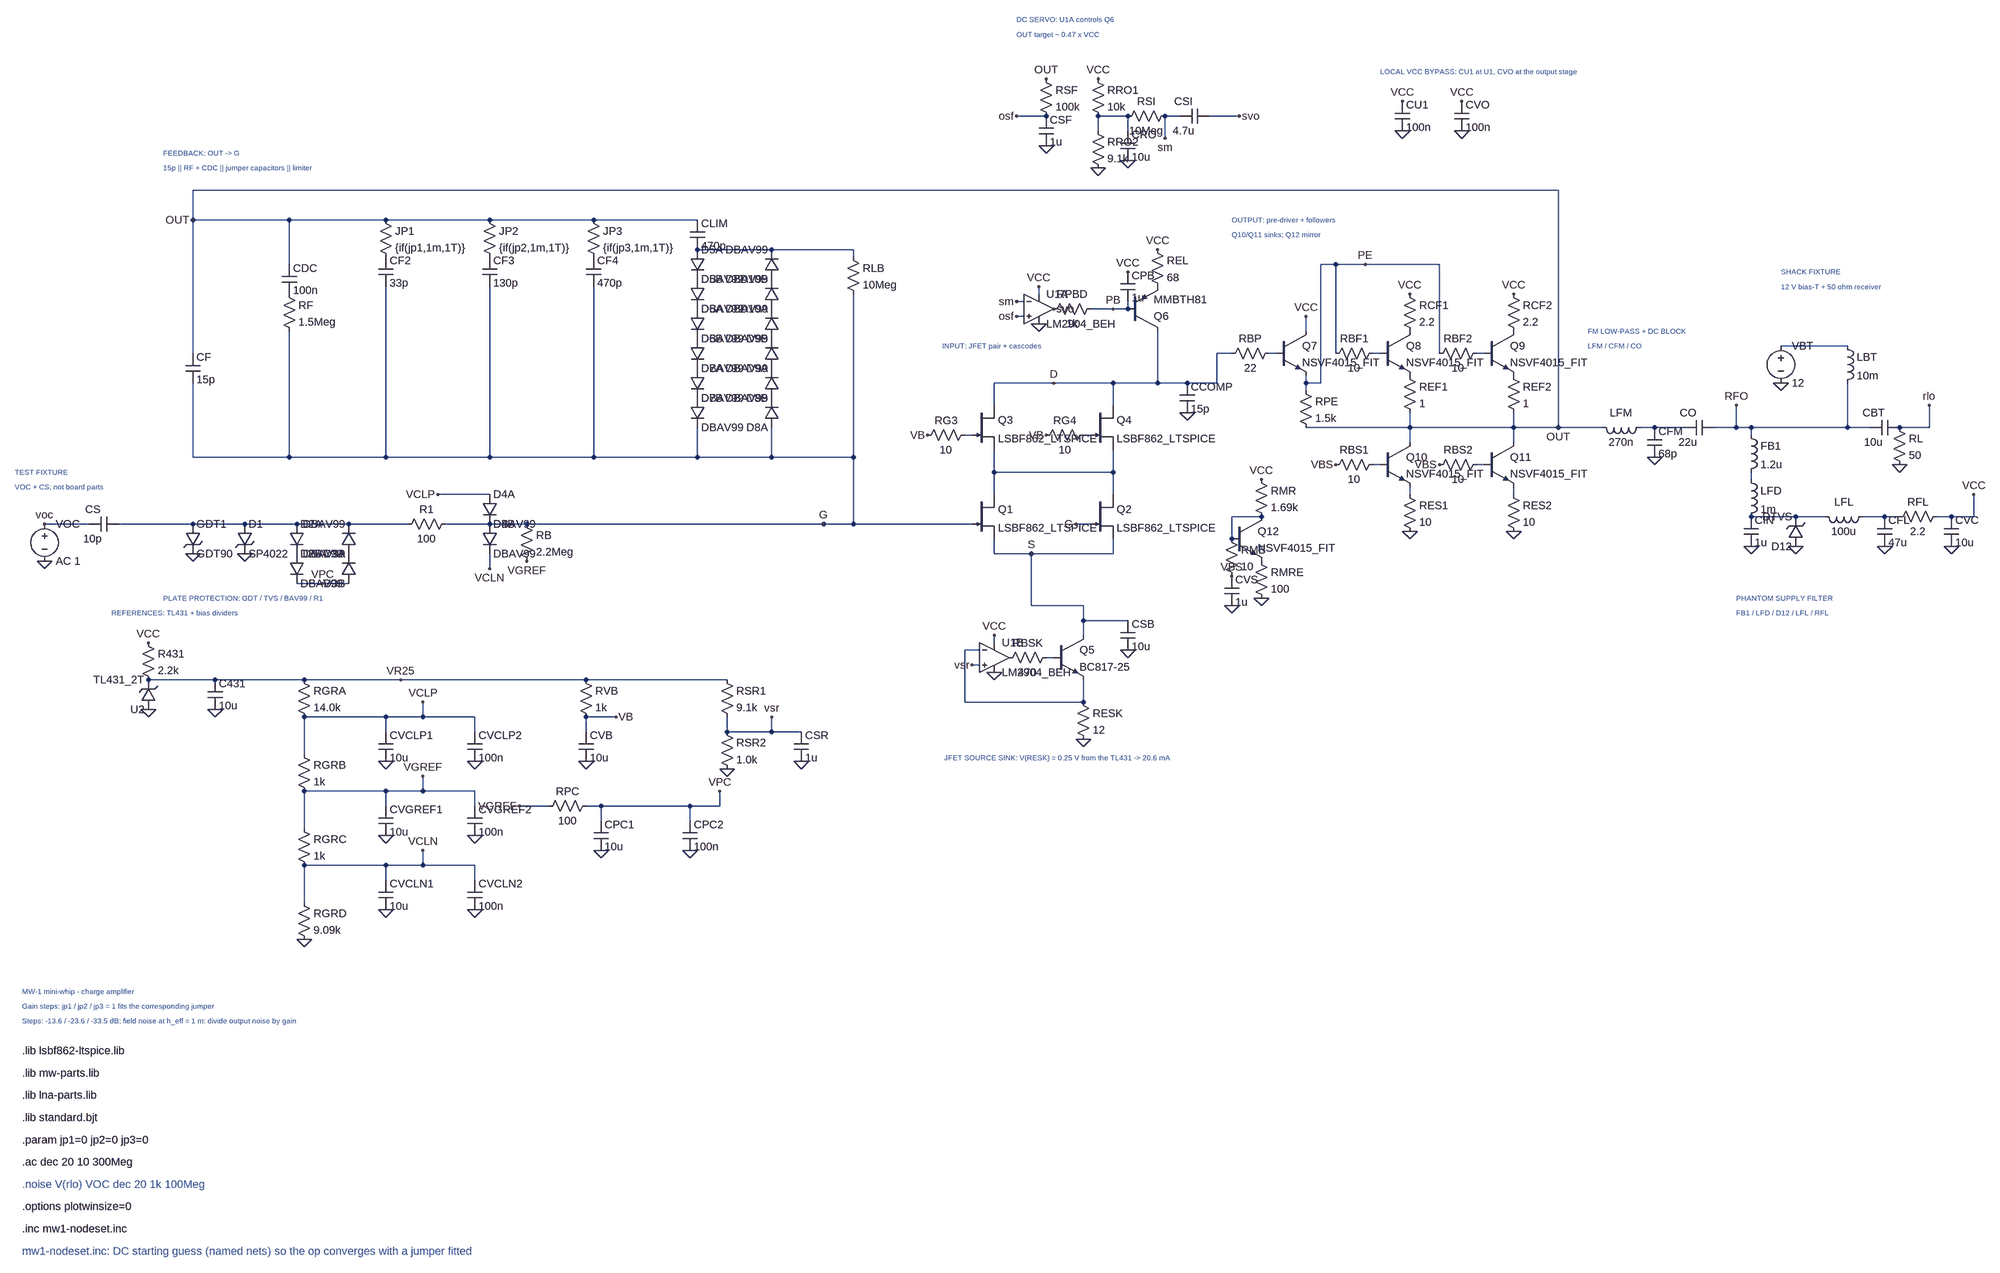
[diagram p0: schematic mw1.asc]
mw1.asc, the LTspice schematic file:
Version 4
SHEET 1 4400 2000
WIRE -2560 -144 -2464 -144
WIRE -2016 -16 -1960 -16
WIRE -1960 -16 -1904 -16
WIRE -2400 -144 -2240 -144
WIRE -2240 -144 -2128 -144
WIRE -2128 -144 -2016 -144
WIRE -2016 -144 -1904 -144
WIRE -1904 -144 -1776 -144
WIRE -1712 -208 -1600 -208
WIRE -1600 -80 -1600 -48
WIRE -2240 -800 -2240 -512
WIRE -2240 -448 -2240 -288
WIRE -2032 -800 -2032 -704
WIRE -2032 -560 -2032 -288
WIRE -1824 -656 -1824 -288
WIRE -1600 -656 -1600 -288
WIRE -1376 -656 -1376 -288
WIRE -1152 -736 -992 -736
WIRE -992 -736 -816 -736
WIRE -816 -736 -816 -720
WIRE -1152 -352 -1152 -288
WIRE -992 -352 -992 -288
WIRE -816 -640 -816 -288
WIRE -2240 -800 -2032 -800
WIRE -2032 -800 -1824 -800
WIRE -1824 -800 -1600 -800
WIRE -1600 -800 -1376 -800
WIRE -1376 -800 -1152 -800
WIRE -2240 -288 -2032 -288
WIRE -2032 -288 -1824 -288
WIRE -1824 -288 -1600 -288
WIRE -1600 -288 -1376 -288
WIRE -1376 -288 -1152 -288
WIRE -1152 -288 -992 -288
WIRE -992 -288 -816 -288
WIRE -816 -288 -816 -144
WIRE -880 -144 -816 -144
WIRE -1696 -144 -1600 -144
WIRE -1600 -144 -1520 -144
WIRE -1520 -144 -880 -144
WIRE -880 -144 -816 -144
WIRE -816 -144 -592 -144
WIRE -592 -144 -560 -144
WIRE -336 -144 -304 -144
WIRE -512 -256 -512 -208
WIRE -512 -256 -256 -256
WIRE -256 -256 -256 -208
WIRE -512 -304 -512 -256
WIRE -256 -304 -256 -256
WIRE -512 -112 -512 -80
WIRE -512 -80 -432 -80
WIRE -432 -80 -256 -80
WIRE -256 -112 -256 -80
WIRE -576 -336 -560 -336
WIRE -320 -336 -304 -336
WIRE -512 -448 -512 -400
WIRE -256 -448 -256 -400
WIRE -512 -448 -384 -448
WIRE -384 -448 -256 -448
WIRE -256 -448 -160 -448
WIRE -160 -448 -96 -448
WIRE -96 -448 -32 -448
WIRE -32 -512 -32 -448
WIRE -32 -512 0 -512
WIRE -320 64 -320 96
WIRE -432 -80 -432 32
WIRE -432 32 -320 32
WIRE -320 32 -320 64
WIRE -320 64 -224 64
WIRE -320 192 -320 240
WIRE -400 144 -384 144
WIRE -576 128 -544 128
WIRE -576 128 -576 240
WIRE -576 240 -320 240
WIRE -560 160 -544 160
WIRE -512 96 -512 112
WIRE -160 -560 -160 -448
WIRE -288 -608 -256 -608
WIRE -256 -608 -224 -608
WIRE -224 -624 -224 -608
WIRE -304 -608 -288 -608
WIRE -464 -592 -448 -592
WIRE -464 -624 -448 -624
WIRE -416 -656 -416 -640
WIRE -464 -1024 -400 -1024
WIRE -288 -1024 -288 -992
WIRE -288 -1024 -224 -1024
WIRE -224 -1024 -224 -992
WIRE -144 -1024 -112 -1024
WIRE -144 -1024 -144 -976
WIRE -48 -1024 16 -1024
WIRE 80 -512 96 -512
WIRE 160 -592 160 -560
WIRE 160 -464 160 -448
WIRE 160 -448 160 -432
WIRE 304 -512 320 -512
WIRE 224 -704 224 -512
WIRE 384 -384 384 -352
WIRE 384 -352 384 -320
WIRE 384 -224 384 -208
WIRE 304 -272 320 -272
WIRE 528 -512 544 -512
WIRE 448 -704 448 -512
WIRE 608 -384 608 -352
WIRE 608 -352 608 -320
WIRE 608 -224 608 -208
WIRE 528 -272 544 -272
WIRE 160 -448 192 -448
WIRE 192 -704 192 -448
WIRE 192 -704 224 -704
WIRE 224 -704 288 -704
WIRE 288 -704 448 -704
WIRE 160 -352 384 -352
WIRE 384 -352 608 -352
WIRE 608 -352 704 -352
WIRE 704 -352 800 -352
WIRE 704 -864 704 -352
WIRE -2240 -864 704 -864
WIRE -2240 -864 -2240 -800
WIRE 0 -160 0 -112
WIRE 0 -160 64 -160
WIRE 880 -352 912 -352
WIRE 912 -352 976 -352
WIRE 1088 -400 1088 -352
WIRE 1040 -352 1088 -352
WIRE 1088 -352 1120 -352
WIRE 1120 -352 1120 -336
WIRE 1120 -256 1120 -240
WIRE 1120 -160 1216 -160
WIRE 1216 -160 1280 -160
WIRE 1360 -160 1408 -160
WIRE 1408 -160 1440 -160
WIRE 1520 -160 1552 -160
WIRE 1552 -160 1600 -160
WIRE 1600 -208 1600 -160
WIRE 1120 -352 1328 -352
WIRE 1328 -352 1376 -352
WIRE 1440 -352 1504 -352
WIRE 1504 -400 1504 -352
WIRE 1328 -448 1328 -352
WIRE 1184 -528 1328 -528
WIRE -2336 192 -2192 192
WIRE -2192 192 -2000 192
WIRE -2000 192 -1792 192
WIRE -1792 192 -1392 192
WIRE -1392 192 -1088 192
WIRE -2000 272 -2000 352
WIRE -2000 272 -1824 272
WIRE -1824 272 -1744 272
WIRE -1744 272 -1632 272
WIRE -1744 240 -1744 272
WIRE -1824 272 -1824 304
WIRE -1632 272 -1632 304
WIRE -2000 432 -2000 512
WIRE -2000 432 -1824 432
WIRE -1824 432 -1744 432
WIRE -1744 432 -1632 432
WIRE -1744 400 -1744 432
WIRE -1824 432 -1824 464
WIRE -1632 432 -1632 464
WIRE -2000 592 -2000 672
WIRE -2000 592 -1824 592
WIRE -1824 592 -1744 592
WIRE -1744 592 -1632 592
WIRE -1744 560 -1744 592
WIRE -1824 592 -1824 624
WIRE -1632 592 -1632 624
WIRE -1536 464 -1472 464
WIRE -1392 464 -1360 464
WIRE -1360 464 -1168 464
WIRE -1168 464 -1104 464
WIRE -1360 464 -1360 496
WIRE -1168 464 -1168 496
WIRE -1104 432 -1104 464
WIRE -1392 272 -1392 304
WIRE -1392 272 -1328 272
WIRE -1088 272 -1088 304
WIRE -1088 304 -992 304
WIRE -992 304 -928 304
WIRE -992 272 -992 304
FLAG -2560 -64 0
FLAG -2560 -144 voc
FLAG -2240 -80 0
FLAG -2128 -80 0
FLAG -1960 -16 VPC
FLAG -1712 -208 VCLP
FLAG -1600 -48 VCLN
FLAG -1520 -64 VGREF
FLAG -2240 -800 OUT
FLAG -880 -144 G
FLAG -336 -144 G
FLAG -432 -80 S
FLAG -656 -336 VB
FLAG -400 -336 VB
FLAG -384 -448 D
FLAG -96 -384 0
FLAG -224 128 0
FLAG -320 320 0
FLAG -560 160 vsr
FLAG -512 96 VCC
FLAG -512 176 0
FLAG -160 -736 VCC
FLAG -256 -608 PB
FLAG -224 -688 VCC
FLAG -464 -592 osf
FLAG -464 -624 sm
FLAG -416 -656 VCC
FLAG -416 -576 0
FLAG -384 -608 svo
FLAG -400 -1104 OUT
FLAG -400 -960 0
FLAG -464 -1024 osf
FLAG -288 -1104 VCC
FLAG -288 -912 0
FLAG -224 -928 0
FLAG -144 -976 sm
FLAG 16 -1024 svo
FLAG -384 -608 svo
FLAG 160 -592 VCC
FLAG 384 -640 VCC
FLAG 384 -128 0
FLAG 224 -272 VBS
FLAG 608 -640 VCC
FLAG 608 -128 0
FLAG 448 -272 VBS
FLAG 288 -704 PE
FLAG 704 -352 OUT
FLAG 64 -240 VCC
FLAG 64 16 0
FLAG 0 -32 VBS
FLAG 0 32 0
FLAG 368 -1056 VCC
FLAG 368 -992 0
FLAG 496 -1056 VCC
FLAG 496 -992 0
FLAG 912 -288 0
FLAG 1088 -400 RFO
FLAG 1120 -96 0
FLAG 1216 -96 0
FLAG 1408 -96 0
FLAG 1552 -96 0
FLAG 1600 -208 VCC
FLAG 1440 -272 0
FLAG 1504 -400 rlo
FLAG 1184 -448 0
FLAG -2336 112 VCC
FLAG -2336 256 0
FLAG -2192 256 0
FLAG -1792 192 VR25
FLAG -2000 752 0
FLAG -1744 240 VCLP
FLAG -1824 368 0
FLAG -1632 368 0
FLAG -1744 400 VGREF
FLAG -1824 528 0
FLAG -1632 528 0
FLAG -1744 560 VCLN
FLAG -1824 688 0
FLAG -1632 688 0
FLAG -1536 464 VGREF
FLAG -1360 560 0
FLAG -1168 560 0
FLAG -1104 432 VPC
FLAG -1392 368 0
FLAG -1328 272 VB
FLAG -1088 384 0
FLAG -928 368 0
FLAG -992 272 vsr
SYMBOL voltage -2560 -160 R0
SYMATTR InstName VOC
SYMATTR Value AC 1
SYMBOL cap -2400 -160 R90
WINDOW 0 0 56 VBottom 2
WINDOW 3 32 56 VTop 2
SYMATTR InstName CS
SYMATTR Value 10p
SYMBOL zener -2256 -144 R0
SYMATTR Prefix X
SYMATTR InstName GDT1
SYMATTR Value GDT90
SYMBOL TVSdiode -2144 -144 R0
SYMATTR Prefix X
SYMATTR InstName D1
SYMATTR Value SP4022
SYMBOL diode -2032 -144 R0
SYMATTR InstName D2A
SYMATTR Value DBAV99
SYMBOL diode -2032 -80 R0
SYMATTR InstName D2B
SYMATTR Value DBAV99
SYMBOL diode -1888 -80 R180
SYMATTR InstName D3A
SYMATTR Value DBAV99
SYMBOL diode -1888 -16 R180
SYMATTR InstName D3B
SYMATTR Value DBAV99
SYMBOL res -1680 -160 R90
WINDOW 0 0 56 VBottom 2
WINDOW 3 32 56 VTop 2
SYMATTR InstName R1
SYMATTR Value 100
SYMBOL diode -1616 -208 R0
SYMATTR InstName D4A
SYMATTR Value DBAV99
SYMBOL diode -1616 -144 R0
SYMATTR InstName D4B
SYMATTR Value DBAV99
SYMBOL res -1536 -160 R0
SYMATTR InstName RB
SYMATTR Value 2.2Meg
SYMBOL cap -2256 -512 R0
SYMATTR InstName CF
SYMATTR Value 15p
SYMBOL cap -2048 -704 R0
SYMATTR InstName CDC
SYMATTR Value 100n
SYMBOL res -2048 -656 R0
SYMATTR InstName RF
SYMATTR Value 1.5Meg
SYMBOL res -1840 -816 R0
SYMATTR InstName JP1
SYMATTR Value {if(jp1,1m,1T)}
SYMBOL cap -1840 -720 R0
SYMATTR InstName CF2
SYMATTR Value 33p
SYMBOL res -1616 -816 R0
SYMATTR InstName JP2
SYMATTR Value {if(jp2,1m,1T)}
SYMBOL cap -1616 -720 R0
SYMATTR InstName CF3
SYMATTR Value 130p
SYMBOL res -1392 -816 R0
SYMATTR InstName JP3
SYMATTR Value {if(jp3,1m,1T)}
SYMBOL cap -1392 -720 R0
SYMATTR InstName CF4
SYMATTR Value 470p
SYMBOL cap -1168 -800 R0
SYMATTR InstName CLIM
SYMATTR Value 470p
SYMBOL diode -1168 -736 R0
SYMATTR InstName D5A
SYMATTR Value DBAV99
SYMBOL diode -1168 -672 R0
SYMATTR InstName D5B
SYMATTR Value DBAV99
SYMBOL diode -1168 -608 R0
SYMATTR InstName D6A
SYMATTR Value DBAV99
SYMBOL diode -1168 -544 R0
SYMATTR InstName D6B
SYMATTR Value DBAV99
SYMBOL diode -1168 -480 R0
SYMATTR InstName D7A
SYMATTR Value DBAV99
SYMBOL diode -1168 -416 R0
SYMATTR InstName D7B
SYMATTR Value DBAV99
SYMBOL diode -976 -352 R180
SYMATTR InstName D8A
SYMATTR Value DBAV99
SYMBOL diode -976 -416 R180
SYMATTR InstName D8B
SYMATTR Value DBAV99
SYMBOL diode -976 -480 R180
SYMATTR InstName D9A
SYMATTR Value DBAV99
SYMBOL diode -976 -544 R180
SYMATTR InstName D9B
SYMATTR Value DBAV99
SYMBOL diode -976 -608 R180
SYMATTR InstName D10A
SYMATTR Value DBAV99
SYMBOL diode -976 -672 R180
SYMATTR InstName D10B
SYMATTR Value DBAV99
SYMBOL res -832 -736 R0
SYMATTR InstName RLB
SYMATTR Value 10Meg
SYMBOL njf -560 -208 R0
SYMATTR InstName Q1
SYMATTR Value LSBF862_LTSPICE
SYMBOL njf -304 -208 R0
SYMATTR InstName Q2
SYMATTR Value LSBF862_LTSPICE
SYMBOL njf -560 -400 R0
SYMATTR InstName Q3
SYMATTR Value LSBF862_LTSPICE
SYMBOL njf -304 -400 R0
SYMATTR InstName Q4
SYMATTR Value LSBF862_LTSPICE
SYMBOL res -560 -352 R90
WINDOW 0 0 56 VBottom 2
WINDOW 3 32 56 VTop 2
SYMATTR InstName RG3
SYMATTR Value 10
SYMBOL res -304 -352 R90
WINDOW 0 0 56 VBottom 2
WINDOW 3 32 56 VTop 2
SYMATTR InstName RG4
SYMATTR Value 10
SYMBOL cap -112 -448 R0
SYMATTR InstName CCOMP
SYMATTR Value 15p
SYMBOL npn -384 96 R0
SYMATTR InstName Q5
SYMATTR Value BC817-25
SYMBOL cap -240 64 R0
SYMATTR InstName CSB
SYMATTR Value 10u
SYMBOL res -336 224 R0
SYMATTR InstName RESK
SYMATTR Value 12
SYMBOL res -384 128 R90
WINDOW 0 0 56 VBottom 2
WINDOW 3 32 56 VTop 2
SYMATTR InstName RBSK
SYMATTR Value 470
SYMBOL OpAmps\\opamp2 -512 80 R0
SYMATTR Prefix X
SYMATTR InstName U1B
SYMATTR Value LM2904_BEH
SYMBOL pnp -224 -560 M180
SYMATTR InstName Q6
SYMATTR Value MMBTH81
SYMBOL res -176 -752 R0
SYMATTR InstName REL
SYMATTR Value 68
SYMBOL cap -240 -688 R0
SYMATTR InstName CPB
SYMATTR Value 1u
SYMBOL res -288 -624 R90
WINDOW 0 0 56 VBottom 2
WINDOW 3 32 56 VTop 2
SYMATTR InstName RPBD
SYMATTR Value 1k
SYMBOL OpAmps\\opamp2 -416 -672 R0
SYMATTR Prefix X
SYMATTR InstName U1A
SYMATTR Value LM2904_BEH
SYMBOL res -416 -1120 R0
SYMATTR InstName RSF
SYMATTR Value 100k
SYMBOL cap -416 -1024 R0
SYMATTR InstName CSF
SYMATTR Value 1u
SYMBOL res -304 -1120 R0
SYMATTR InstName RRO1
SYMATTR Value 10k
SYMBOL res -304 -1008 R0
SYMATTR InstName RRO2
SYMATTR Value 9.1k
SYMBOL cap -240 -992 R0
SYMATTR InstName CRO
SYMATTR Value 10u
SYMBOL res -128 -1040 R90
WINDOW 0 0 56 VBottom 2
WINDOW 3 32 56 VTop 2
SYMATTR InstName RSI
SYMATTR Value 10Meg
SYMBOL cap -48 -1040 R90
WINDOW 0 0 56 VBottom 2
WINDOW 3 32 56 VTop 2
SYMATTR InstName CSI
SYMATTR Value 4.7u
SYMBOL npn 96 -560 R0
SYMATTR Prefix X
SYMATTR InstName Q7
SYMATTR Value NSVF4015_FIT
SYMBOL res 96 -528 R90
WINDOW 0 0 56 VBottom 2
WINDOW 3 32 56 VTop 2
SYMATTR InstName RBP
SYMATTR Value 22
SYMBOL res 144 -448 R0
SYMATTR InstName RPE
SYMATTR Value 1.5k
SYMBOL npn 320 -560 R0
SYMATTR Prefix X
SYMATTR InstName Q8
SYMATTR Value NSVF4015_FIT
SYMBOL res 320 -528 R90
WINDOW 0 0 56 VBottom 2
WINDOW 3 32 56 VTop 2
SYMATTR InstName RBF1
SYMATTR Value 10
SYMBOL res 368 -656 R0
SYMATTR InstName RCF1
SYMATTR Value 2.2
SYMBOL res 368 -480 R0
SYMATTR InstName REF1
SYMATTR Value 1
SYMBOL npn 320 -320 R0
SYMATTR Prefix X
SYMATTR InstName Q10
SYMATTR Value NSVF4015_FIT
SYMBOL res 368 -224 R0
SYMATTR InstName RES1
SYMATTR Value 10
SYMBOL res 320 -288 R90
WINDOW 0 0 56 VBottom 2
WINDOW 3 32 56 VTop 2
SYMATTR InstName RBS1
SYMATTR Value 10
SYMBOL npn 544 -560 R0
SYMATTR Prefix X
SYMATTR InstName Q9
SYMATTR Value NSVF4015_FIT
SYMBOL res 544 -528 R90
WINDOW 0 0 56 VBottom 2
WINDOW 3 32 56 VTop 2
SYMATTR InstName RBF2
SYMATTR Value 10
SYMBOL res 592 -656 R0
SYMATTR InstName RCF2
SYMATTR Value 2.2
SYMBOL res 592 -480 R0
SYMATTR InstName REF2
SYMATTR Value 1
SYMBOL npn 544 -320 R0
SYMATTR Prefix X
SYMATTR InstName Q11
SYMATTR Value NSVF4015_FIT
SYMBOL res 592 -224 R0
SYMATTR InstName RES2
SYMATTR Value 10
SYMBOL res 544 -288 R90
WINDOW 0 0 56 VBottom 2
WINDOW 3 32 56 VTop 2
SYMATTR InstName RBS2
SYMATTR Value 10
SYMBOL npn 0 -160 R0
SYMATTR Prefix X
SYMATTR InstName Q12
SYMATTR Value NSVF4015_FIT
SYMBOL res 48 -256 R0
SYMATTR InstName RMR
SYMATTR Value 1.69k
SYMBOL res 48 -80 R0
SYMATTR InstName RMRE
SYMATTR Value 100
SYMBOL res -16 -128 R0
SYMATTR InstName RMB
SYMATTR Value 10
SYMBOL cap -16 -32 R0
SYMATTR InstName CVS
SYMATTR Value 1u
SYMBOL cap 352 -1056 R0
SYMATTR InstName CU1
SYMATTR Value 100n
SYMBOL cap 480 -1056 R0
SYMATTR InstName CVO
SYMATTR Value 100n
SYMBOL ind 896 -368 R90
WINDOW 0 0 56 VBottom 2
WINDOW 3 32 56 VTop 2
SYMATTR InstName LFM
SYMATTR Value 270n
SYMBOL cap 896 -352 R0
SYMATTR InstName CFM
SYMATTR Value 68p
SYMBOL cap 1040 -368 R90
WINDOW 0 0 56 VBottom 2
WINDOW 3 32 56 VTop 2
SYMATTR InstName CO
SYMATTR Value 22u
SYMBOL ind 1104 -352 R0
SYMATTR InstName FB1
SYMATTR Value 1.2u
SYMATTR SpiceLine Rser=0.15 Rpar=600 Cpar=0.2p
SYMBOL ind 1104 -256 R0
SYMATTR InstName LFD
SYMATTR Value 1m
SYMATTR SpiceLine Rser=6 Cpar=7p
SYMBOL cap 1104 -160 R0
SYMATTR InstName CIN
SYMATTR Value 1u
SYMBOL zener 1232 -96 R180
SYMATTR InstName D12
SYMATTR Value DTVS
SYMBOL ind 1376 -176 R90
WINDOW 0 0 56 VBottom 2
WINDOW 3 32 56 VTop 2
SYMATTR InstName LFL
SYMATTR Value 100u
SYMATTR SpiceLine Rser=1 Cpar=6.8p
SYMBOL cap 1392 -160 R0
SYMATTR InstName CFL
SYMATTR Value 47u
SYMBOL res 1536 -176 R90
WINDOW 0 0 56 VBottom 2
WINDOW 3 32 56 VTop 2
SYMATTR InstName RFL
SYMATTR Value 2.2
SYMBOL cap 1536 -160 R0
SYMATTR InstName CVC
SYMATTR Value 10u
SYMBOL cap 1440 -368 R90
WINDOW 0 0 56 VBottom 2
WINDOW 3 32 56 VTop 2
SYMATTR InstName CBT
SYMATTR Value 10u
SYMBOL res 1424 -368 R0
SYMATTR InstName RL
SYMATTR Value 50
SYMBOL ind 1312 -544 R0
SYMATTR InstName LBT
SYMATTR Value 10m
SYMBOL voltage 1184 -544 R0
SYMATTR InstName VBT
SYMATTR Value 12
SYMBOL res -2352 96 R0
SYMATTR InstName R431
SYMATTR Value 2.2k
SYMBOL zener -2320 256 R180
SYMATTR Prefix X
SYMATTR InstName U2
SYMATTR Value TL431_2T
SYMBOL cap -2208 192 R0
SYMATTR InstName C431
SYMATTR Value 10u
SYMBOL res -2016 176 R0
SYMATTR InstName RGRA
SYMATTR Value 14.0k
SYMBOL res -2016 336 R0
SYMATTR InstName RGRB
SYMATTR Value 1k
SYMBOL res -2016 496 R0
SYMATTR InstName RGRC
SYMATTR Value 1k
SYMBOL res -2016 656 R0
SYMATTR InstName RGRD
SYMATTR Value 9.09k
SYMBOL cap -1840 304 R0
SYMATTR InstName CVCLP1
SYMATTR Value 10u
SYMBOL cap -1648 304 R0
SYMATTR InstName CVCLP2
SYMATTR Value 100n
SYMBOL cap -1840 464 R0
SYMATTR InstName CVGREF1
SYMATTR Value 10u
SYMBOL cap -1648 464 R0
SYMATTR InstName CVGREF2
SYMATTR Value 100n
SYMBOL cap -1840 624 R0
SYMATTR InstName CVCLN1
SYMATTR Value 10u
SYMBOL cap -1648 624 R0
SYMATTR InstName CVCLN2
SYMATTR Value 100n
SYMBOL res -1376 448 R90
WINDOW 0 0 56 VBottom 2
WINDOW 3 32 56 VTop 2
SYMATTR InstName RPC
SYMATTR Value 100
SYMBOL cap -1376 496 R0
SYMATTR InstName CPC1
SYMATTR Value 10u
SYMBOL cap -1184 496 R0
SYMATTR InstName CPC2
SYMATTR Value 100n
SYMBOL res -1408 176 R0
SYMATTR InstName RVB
SYMATTR Value 1k
SYMBOL cap -1408 304 R0
SYMATTR InstName CVB
SYMATTR Value 10u
SYMBOL res -1104 176 R0
SYMATTR InstName RSR1
SYMATTR Value 9.1k
SYMBOL res -1104 288 R0
SYMATTR InstName RSR2
SYMATTR Value 1.0k
SYMBOL cap -944 304 R0
SYMATTR InstName CSR
SYMATTR Value 1u
TEXT -2624 -256 Left 1 ;TEST FIXTURE
TEXT -2624 -224 Left 1 ;VOC + CS; not board parts
TEXT -2304 16 Left 1 ;PLATE PROTECTION: GDT / TVS / BAV99 / R1
TEXT -2304 -944 Left 1 ;FEEDBACK: OUT -> G
TEXT -2304 -912 Left 1 ;15p || RF + CDC || jumper capacitors || limiter
TEXT -624 -528 Left 1 ;INPUT: JFET pair + cascodes
TEXT -620 360 Left 1 ;JFET SOURCE SINK: V(RESK) = 0.25 V from the TL431 -> 20.6 mA
TEXT -464 -1232 Left 1 ;DC SERVO: U1A controls Q6
TEXT -464 -1200 Left 1 ;OUT target ~ 0.47 x VCC
TEXT 320 -1120 Left 1 ;LOCAL VCC BYPASS: CU1 at U1, CVO at the output stage
TEXT 0 -800 Left 1 ;OUTPUT: pre-driver + followers
TEXT 0 -768 Left 1 ;Q10/Q11 sinks; Q12 mirror
TEXT 768 -560 Left 1 ;FM LOW-PASS + DC BLOCK
TEXT 768 -528 Left 1 ;LFM / CFM / CO
TEXT 1088 16 Left 1 ;PHANTOM SUPPLY FILTER
TEXT 1088 48 Left 1 ;FB1 / LFD / D12 / LFL / RFL
TEXT 1184 -688 Left 1 ;SHACK FIXTURE
TEXT 1184 -656 Left 1 ;12 V bias-T + 50 ohm receiver
TEXT -2416 48 Left 1 ;REFERENCES: TL431 + bias dividers
TEXT -2608 864 Left 1 ;MW-1 mini-whip - charge amplifier
TEXT -2608 896 Left 1 ;Gain steps: jp1 / jp2 / jp3 = 1 fits the corresponding jumper
TEXT -2608 928 Left 1 ;Steps: -13.6 / -23.6 / -33.5 dB; field noise at h_eff = 1 m: divide output noise by gain
TEXT -2608 992 Left 2 !.lib lsbf862-ltspice.lib
TEXT -2608 1040 Left 2 !.lib mw-parts.lib
TEXT -2608 1088 Left 2 !.lib lna-parts.lib
TEXT -2608 1136 Left 2 !.lib standard.bjt
TEXT -2608 1184 Left 2 !.param jp1=0 jp2=0 jp3=0
TEXT -2608 1232 Left 2 !.ac dec 20 10 300Meg
TEXT -2608 1280 Left 2 ;.noise V(rlo) VOC dec 20 1k 100Meg
TEXT -2608 1328 Left 2 !.options plotwinsize=0
TEXT -2608 1376 Left 2 !.inc mw1-nodeset.inc
TEXT -2608 1424 Left 2 ;mw1-nodeset.inc: DC starting guess (named nets) so the op converges with a jumper fitted

The netlist it stands for:
* mw1.asc
VOC voc 0 AC 1
CS N001 voc 10p
XGDT1 N001 0 GDT90  ; pins + -
XD1 N001 0 SP4022  ; pins + -
D2A N001 P001 DBAV99
D2B P001 VPC DBAV99
D3A P002 N001 DBAV99
D3B VPC P002 DBAV99
R1 G N001 100
D4A VCLP G DBAV99
D4B G VCLN DBAV99
RB G VGREF 2.2Meg
CF OUT G 15p
CDC OUT P003 100n
RF P003 G 1.5Meg
R§JP1 OUT P004 {if(jp1,1m,1T)}
CF2 P004 G 33p
R§JP2 OUT P005 {if(jp2,1m,1T)}
CF3 P005 G 130p
R§JP3 OUT P006 {if(jp3,1m,1T)}
CF4 P006 G 470p
CLIM OUT N002 470p
D5A N002 P007 DBAV99
D5B P007 P008 DBAV99
D6A P008 P009 DBAV99
D6B P009 P010 DBAV99
D7A P010 P011 DBAV99
D7B P011 G DBAV99
D8A G P012 DBAV99
D8B P012 P013 DBAV99
D9A P013 P014 DBAV99
D9B P014 P015 DBAV99
D10A P015 P016 DBAV99
D10B P016 N002 DBAV99
RLB N002 G 10Meg
J§Q1 N003 G S LSBF862_LTSPICE
J§Q2 N003 G S LSBF862_LTSPICE
J§Q3 D N004 N003 LSBF862_LTSPICE
J§Q4 D N005 N003 LSBF862_LTSPICE
RG3 N004 VB 10
RG4 N005 VB 10
CCOMP D 0 15p
Q5 S N007 N006 0 BC817-25
CSB S 0 10u
RESK N006 0 12
RBSK N007 P017 470
XU1B vsr N006 VCC 0 P017 LM2904_BEH  ; pins In+ In- V+ V- OUT
Q6 D PB P018 0 MMBTH81
REL VCC P018 68
CPB VCC PB 1u
RPBD PB svo 1k
XU1A osf sm VCC 0 svo LM2904_BEH  ; pins In+ In- V+ V- OUT
RSF OUT osf 100k
CSF osf 0 1u
RRO1 VCC N008 10k
RRO2 N008 0 9.1k
CRO N008 0 10u
RSI sm N008 10Meg
CSI svo sm 4.7u
XQ7 VCC N009 PE NSVF4015_FIT  ; pins C B E
RBP N009 D 22
RPE PE OUT 1.5k
XQ8 P019 N010 P020 NSVF4015_FIT  ; pins C B E
RBF1 N010 PE 10
RCF1 VCC P019 2.2
REF1 P020 OUT 1
XQ10 OUT N012 N011 NSVF4015_FIT  ; pins C B E
RES1 N011 0 10
RBS1 N012 VBS 10
XQ9 P021 N013 P022 NSVF4015_FIT  ; pins C B E
RBF2 N013 PE 10
RCF2 VCC P021 2.2
REF2 P022 OUT 1
XQ11 OUT N015 N014 NSVF4015_FIT  ; pins C B E
RES2 N014 0 10
RBS2 N015 VBS 10
XQ12 N016 N016 P023 NSVF4015_FIT  ; pins C B E
RMR VCC N016 1.69k
RMRE P023 0 100
RMB N016 VBS 10
CVS VBS 0 1u
CU1 VCC 0 100n
CVO VCC 0 100n
LFM N017 OUT 270n
CFM N017 0 68p
CO RFO N017 22u
L§FB1 RFO N018 1.2u Rser=0.15 Rpar=600 Cpar=0.2p
LFD N018 N019 1m Rser=6 Cpar=7p
CIN N019 0 1u
D12 0 N019 DTVS
LFL N020 N019 100u Rser=1 Cpar=6.8p
CFL N020 0 47u
RFL VCC N020 2.2
CVC VCC 0 10u
CBT rlo RFO 10u
RL rlo 0 50
LBT N021 RFO 10m
VBT N021 0 12
R431 VCC VR25 2.2k
XU2 0 VR25 TL431_2T  ; pins + -
C431 VR25 0 10u
RGRA VR25 VCLP 14.0k
RGRB VCLP VGREF 1k
RGRC VGREF VCLN 1k
RGRD VCLN 0 9.09k
CVCLP1 VCLP 0 10u
CVCLP2 VCLP 0 100n
CVGREF1 VGREF 0 10u
CVGREF2 VGREF 0 100n
CVCLN1 VCLN 0 10u
CVCLN2 VCLN 0 100n
RPC VPC VGREF 100
CPC1 VPC 0 10u
CPC2 VPC 0 100n
RVB VR25 VB 1k
CVB VB 0 10u
RSR1 VR25 vsr 9.1k
RSR2 vsr 0 1.0k
CSR vsr 0 1u
.model D D
.lib standard.dio
.model NPN NPN
.model PNP PNP
.lib standard.bjt
.model NJF NJF
.model PJF PJF
.lib standard.jft
* TEST FIXTURE
* VOC + CS; not board parts
* PLATE PROTECTION: GDT / TVS / BAV99 / R1
* FEEDBACK: OUT -> G
* 15p || RF + CDC || jumper capacitors || limiter
* INPUT: JFET pair + cascodes
* JFET SOURCE SINK: V(RESK) = 0.25 V from the TL431 -> 20.6 mA
* DC SERVO: U1A controls Q6
* OUT target ~ 0.47 x VCC
* LOCAL VCC BYPASS: CU1 at U1, CVO at the output stage
* OUTPUT: pre-driver + followers
* Q10/Q11 sinks; Q12 mirror
* FM LOW-PASS + DC BLOCK
* LFM / CFM / CO
* PHANTOM SUPPLY FILTER
* FB1 / LFD / D12 / LFL / RFL
* SHACK FIXTURE
* 12 V bias-T + 50 ohm receiver
* REFERENCES: TL431 + bias dividers
* MW-1 mini-whip - charge amplifier
* Gain steps: jp1 / jp2 / jp3 = 1 fits the corresponding jumper
* Steps: -13.6 / -23.6 / -33.5 dB; field noise at h_eff = 1 m: divide output noise by gain
.lib lsbf862-ltspice.lib
.lib mw-parts.lib
.lib lna-parts.lib
.lib standard.bjt
.param jp1=0 jp2=0 jp3=0
.ac dec 20 10 300Meg
* .noise V(rlo) VOC dec 20 1k 100Meg
.options plotwinsize=0
.inc mw1-nodeset.inc
* mw1-nodeset.inc: DC starting guess (named nets) so the op converges with a jumper fitted
.backanno
.end